# Altium project midi-synth.PrjPcb
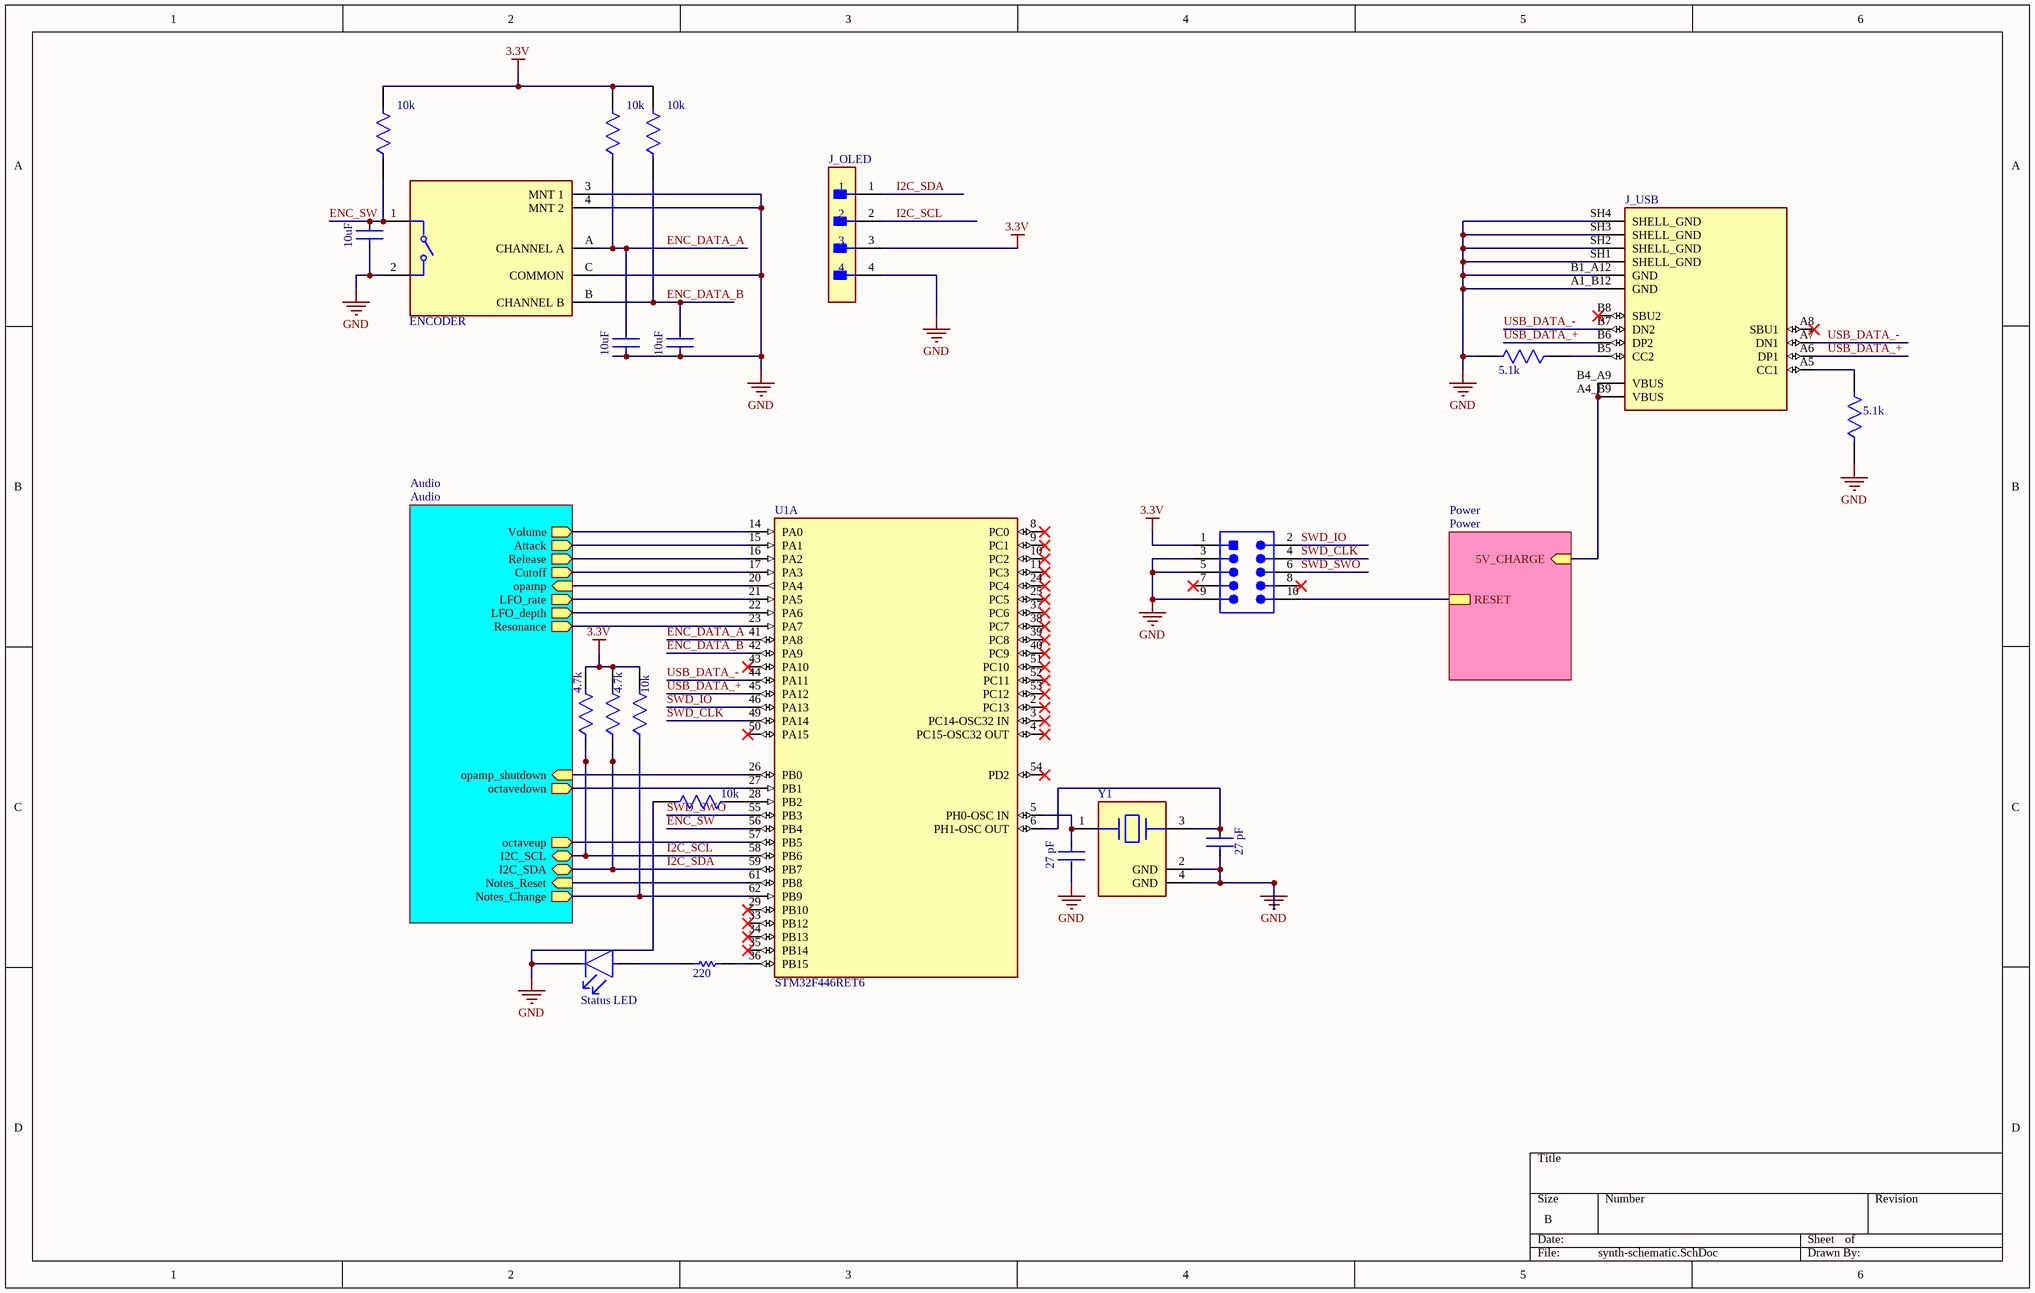
[diagram p0: synth-schematic.SchDoc]
3 sheets, 99 parts. Net scope: hierarchical (ports join the sheet entries above them; power ports are global).
Board file: synth.PcbDoc
Sheets:
  synth-schematic.SchDoc
    Power = Power.SchDoc
    Audio = Audio.SchDoc

## Sheet synth-schematic.SchDoc
size B; SheetNumber: 1; SheetTotal: 3

### Parts
C_ENC_A  10uF  [FP-C0603C106M8PACTU-MFG]
C_ENC_B  10uF  [FP-C0603C106M8PACTU-MFG]
C_ENC_SW  10uF  [FP-C0603C106M8PACTU-MFG]
C_Y_1  27 pF  [FP-C0603C-CF-MFG]
C_Y_2  27 pF  [FP-C0603C-CF-MFG]
ENCODER  PEC11R-4215F-S0024  [FP-PEC11R-4215F-S0024-MFG]  (value not drawn)
J_OLED  HTSW-104-07-G-S  [FP-HTSW-104-07-G-S-MFG]  (value not drawn)
J_USB  USB4105-GF-A-120  [GCT_USB4105-GF-A-120]  (value not drawn)
LED_R1  220  [RESC1608X55X25NL10T15]
R_BOOT_PD  10k  [FP-AC0603-IPC_A]
R_ENC_PU_2  10k  [FP-AC0603-IPC_A]
R_ENC_PU_3  10k  [FP-AC0603-IPC_A]
R_ENC_PU_?  10k  [FP-AC0603-IPC_A]
R_NOTES_PU  10k  [FP-AC0603-IPC_A]
R_PULLUP_SCL  4.7k  [FP-RT0603-MFG]
R_PULLUP_SDA  4.7k  [FP-RT0603-MFG]
R_USB_1  5.1k  [FP-MCT0603-IPC_B]
R_USB_2  5.1k  [FP-MCT0603-IPC_B]
STATUS_LED1  Status LED  [FP-LTST-C190KRKT-MFG]
SWD_HEADER  FTSH-105-01-F-DV-K  [SMTC-FTSH-105-01-L-DV-K_V]  (value not drawn)
U1  STM32F446RET6  [FP-LQFP64-5W-MFG]  (part A of 2)
Y1  ABM3B-8.000MHZ-B2-T  [FP-ABM3B-MFG]  (value not drawn)

### Sub-sheets
Audio = Audio: Volume (out), Attack (out), Release (out), Cutoff (out), LFO_rate (out), LFO_depth (out), Resonance (out), opamp (in), opamp_shutdown (in), octavedown (out), Notes_Reset (in), Notes_Change (out), I2C_SDA (bidir), octaveup (out), I2C_SCL (bidir)
Power = Power: 5V_CHARGE (in), RESET

### Nets
3.3V: J_OLED.3 R_ENC_PU_2.2 R_ENC_PU_3.2 R_ENC_PU_?.2 R_NOTES_PU.2 R_PULLUP_SCL.2 R_PULLUP_SDA.2 SWD_HEADER.1
GND: C_ENC_A.1 C_ENC_B.1 C_ENC_SW.1 C_Y_1.1 C_Y_2.2 ENCODER.2 ENCODER.3(MNT_1) ENCODER.4(MNT_2) ENCODER.C(COMMON) J_OLED.4 J_USB.A1_B12(GND) J_USB.B1_A12(GND) J_USB.SH1(SHELL_GND) J_USB.SH2(SHELL_GND) J_USB.SH3(SHELL_GND) J_USB.SH4(SHELL_GND) R_BOOT_PD.2 R_USB_1.1 R_USB_2.2 STATUS_LED1.1(C) SWD_HEADER.3 SWD_HEADER.5 SWD_HEADER.9 Y1.2(GND) Y1.4(GND)
ENC_DATA_A: C_ENC_A.2 ENCODER.A(CHANNEL_A) R_ENC_PU_?.1 U1.41(PA8)
ENC_DATA_B: C_ENC_B.2 ENCODER.B(CHANNEL_B) R_ENC_PU_2.1 U1.42(PA9)
ENC_SW: C_ENC_SW.2 ENCODER.1 R_ENC_PU_3.1 U1.56(PB4)
I2C_SCL: J_OLED.2 R_PULLUP_SCL.1 U1.58(PB6) ; sheet Audio/I2C_SCL
I2C_SDA: J_OLED.1 R_PULLUP_SDA.1 U1.59(PB7) ; sheet Audio/I2C_SDA
SWD_CLK: SWD_HEADER.4 U1.49(PA14)
SWD_IO: SWD_HEADER.2 U1.46(PA13)
SWD_SWO: SWD_HEADER.6 U1.55(PB3)
USB_DATA_+: J_USB.A6(DP1) J_USB.B6(DP2) U1.45(PA12)
USB_DATA_-: J_USB.A7(DN1) J_USB.B7(DN2) U1.44(PA11)
NetAttack_S: U1.15(PA1) ; sheet Audio/Attack
NetC_Cutoff_1: U1.17(PA3) ; sheet Audio/Cutoff
NetC_in_1: U1.20(PA4) ; sheet Audio/opamp
NetC_LFO_depth_1: U1.22(PA6) ; sheet Audio/LFO_depth
NetC_LFO_rate_1: U1.21(PA5) ; sheet Audio/LFO_rate
NetC_Release_1: U1.16(PA2) ; sheet Audio/Release
NetC_Reset_1: SWD_HEADER.10 ; sheet Power/RESET
NetC_Resonance_1: U1.23(PA7) ; sheet Audio/Resonance
NetC_VDD_2: J_USB.A4_B9(VBUS) J_USB.B4_A9(VBUS) ; sheet Power/5V_CHARGE
NetC_Volume_1: U1.14(PA0) ; sheet Audio/Volume
NetC_Y_1_2: C_Y_1.2 U1.6(PH1-OSC_OUT) Y1.3
NetC_Y_2_1: C_Y_2.1 U1.5(PH0-OSC_IN) Y1.1
NetJ_USB_A5: J_USB.A5(CC1) R_USB_1.2
NetJ_USB_B5: J_USB.B5(CC2) R_USB_2.1
NetLED_R1_1: LED_R1.1 STATUS_LED1.2(A)
NetLED_R1_2: LED_R1.2 U1.36(PB15)
NetOPAMP_1_1: U1.26(PB0) ; sheet Audio/opamp_shutdown
NetR_BOOT_PD_1: R_BOOT_PD.1 U1.28(PB2)
NetR_NOTES_PU_1: R_NOTES_PU.1 U1.62(PB9) ; sheet Audio/Notes_Change
NetS1_octaveup_1: U1.57(PB5) ; sheet Audio/octaveup
NetS2_octavedown_1: U1.27(PB1) ; sheet Audio/octavedown
NetU1_61: U1.61(PB8) ; sheet Audio/Notes_Reset

Not connected (* = marked no-connect by the designer): J_USB A8(SBU1)* B8(SBU2)*; SWD_HEADER 7* 8*; U1 2(PC13)* 3(PC14-OSC32_IN)* 4(PC15-OSC32_OUT)* 8(PC0)* 9(PC1)* 10(PC2)* 11(PC3)* 24(PC4)* 25(PC5)* 29(PB10)* 33(PB12)* 34(PB13)* 35(PB14)* 37(PC6)* 38(PC7)* 39(PC8)* 40(PC9)* 43(PA10)* 50(PA15)* 51(PC10)* 52(PC11)* 53(PC12)* 54(PD2)*

### Library data of the parts
C_ENC_A C_ENC_B C_ENC_SW = CMP-03020-034654-1: CAP CER 10UF 10V X5R 0603; RoHS Compliant: Yes
C_Y_1 C_Y_2 = CMP-03020-007366-1: CAP CER 27PF 100V NP0 0603; Manufacturer: KEMET; Manufacturer Part Number: C0603C270F1GACTU; Temperature Characteristic: C0G; Automotive Grade: Grade 1; Temperature Coefficient: 30ppm/°C; Tolerance: 0.01; Category: Cap; Mouser Description: Multilayer Ceramic Capacitors MLCC - SMD/SMT 100volts 27pF C0G 1%; Octopart: https://octopart.com/c0603c270f1gactu-kemet-9143729; ComponentLink2Description: Datasheet; Package: C0603C-CF; Device Class L2: Capacitors; Temperature Range Low: -55°C; Temperature Range High: +125°C; Height: 0.87mm; Digikey Description: CAP CER 27PF 100V NP0 0603; Temperature: -55°C to +125°C; Device Class L1: Passive Components; Value: 27 pF; Lead Free: Yes; Automotive: Yes; RoHS: TRUE; Device Class L3: Ceramic Capacitors; ComponentLink2URL: https://api.kemet.com/component-edge/download/datasheet/C0603C100J5GACAUTO.pdf; Capacitance: 27 pF; Material: Ceramic; Voltage Rating: 100 V
ENCODER = CMP-1747-00012-2: ROTARY ENCODER MECHANICAL 24PPR; Hole Diameter: 1.8mm; Output Type: Quadrature; Pulses per Revolution: 24; Number of Channels: 2; Built in Switch: Yes; Min Operating Temperature: -30°C; Series: PEC11R; Type: Mechanical; Package Quantity: 150; Length: 21.5mm; Max Operating Temperature: 70°C; Encoder Type: Mechanical; Height: 13.4mm; Detent: Yes; Packaging: Bulk; Orientation: Vertical; Width: 12.5mm; Termination: PC Pins; Mount: Through Hole; REACH SVHC: No SVHC; Radiation Hardening: No; RoHS Compliant: Yes
J_OLED = CMP-02766-001776-1: CONN HEADER VERT 4POS 2.54MM; Gender: Male; Number of Contacts: 4; Packaging: Bulk; RoHS Compliant: Yes; Number of Rows: 1; Mount: Through Hole; Contact Material: Bronze; Series: HTSW; Radiation Hardening: No; Pitch: 2.54mm; Reach SVHC Compliant: Yes; Contact Plating: Gold; Termination: Through Hole
J_USB = USB4105-GF-A-120: USB CONN, 2.0 TYPE C, RCPT, 16POS, SMT; USB Connector Type:USB Type C; USB Standard:USB 2.0; Gender:Receptacle; No. of Positions:16Positions; Connector Mounting:Surface Mount, Through Hole Mount; Orientation:Right Angle RoHS Compliant: Yes; MF: Global Connector Technology; MP: USB4105GFA120; SnapEDA_Link: https://www.snapeda.com/parts/USB4105GFA120/Global+Connector+Technology/view-part/?ref=snap; Package: None; Value: *; Check_prices: https://www.snapeda.com/parts/USB4105GFA120/Global+Connector+Technology/view-part/?ref=eda
LED_R1 = CMP-2000-04322-1: Part Number: RC0603JR-13220RL; Manufacturer: Yageo
R_BOOT_PD R_ENC_PU_2 R_ENC_PU_3 R_ENC_PU_? R_NOTES_PU = CMP-03412-040683-1: RES 10kΩ 5.00% 0.2W 0603
R_PULLUP_SCL R_PULLUP_SDA = CMP-03412-034306-1: RT0603 4.7KΩ 0.1W 25 ppm/°C 0.10%; Manufacturer: Yageo; Manufacturer Part Number: RT0603BRD134K7L; Tolerance: 0.001; Voltage Rating: 75V; Series: RT; Device Class L3: Chip SMD Resistors; Temperature Range High: +155°C; Height: 0.55mm; Temperature Range Low: -55°C; Resistance: 4.7KΩ; Composition: Thin Film; Temperature Coefficient: 25 ppm/°C; Device Class L1: Passive Components; Footprint Url: http://www.yageo.com/exep/pages/download/literatures/PYu-R_Mount_10.pdf; Automotive: No; Category: Res; ComponentLink2URL: http://www.yageo.com/documents/recent/PYu-RT_1-to-0.01_RoHS_L_9.pdf; Temperature: -55°C to +155°C; Ipc Land Pattern Name: RESC16080X45; RoHS: TRUE; Power Rating: 0.1W; Octopart: https://octopart.com/rt0603brd134k7l-yageo-91016342; Package: RT0603; Lead Free: Yes; Value: 4.7KΩ; Device Class L2: Resistors; ComponentLink2Description: Datasheet
R_USB_1 R_USB_2 = CMP-02407-010205-1: RES SMD 100 OHM 1% 1/8W 0603; Resistance: 5.1kR; Tolerance: 0.1%; Temperature Coefficient: 25ppm/°C; Max Operating Temperature: 125°C; Radiation Hardening: No; Composition: Thin Film; Height: 450um; Lead Free: Lead Free; Contact Plating: Tin; Length: 1.55mm; Width: 850um; Case/Package: 0603; Min Operating Temperature: -55°C
STATUS_LED1 = CMP-1674-00011-2: LED RED CLEAR CHIP SMD; Reverse Voltage: 5V; Viewing Angle: 130°; Power Rating: 75mW; Test Current: 20mA; Number of Elements: 1; Lens Color: Colorless; Wavelength: 639nm; Dominant Wavelength: 631nm; Lens Style: Diffused; Forward Current: 30mA; Forward Voltage: 2.4V; Luminous Intensity: 54mcd; Color: Red; Case Code (Imperial): 0603; Lens Transparency: Clear; Lead Free: Lead Free; Package Quantity: 1; Packaging: Tape and Reel; Max Operating Temperature: 85°C; Number of Pins: 2; Height: 0.8mm; Case/Package: 0603; Number of LEDs: 1; Width: 0.8mm; Case Code (Metric): 1608; Depth: 0.8mm; Mount: Surface Mount; Radiation Hardening: No; Length: 1.6mm; Illumination Color: Red; Power Dissipation: 75mW; Min Operating Temperature: -55°C
SWD_HEADER = CMP-2000-05352-1: Male Header, Pitch 1.27 mm, 2 x 5 Position, Height 6.12 mm, RoHS, Tube; Manufacturer: Samtec; Number of Positions: 10; Connector Type: Header,Shrouded; Number of Positions Loaded: All; Row Spacing: 0.050"(1.27mm); Fastening Type: -; Package Reference: FTSH-105-01-L-DV-K; Termination: Solder; Package URL: http://suddendocs.samtec.com/prints/ftsh-1xx-xx-xxx-dv-xxx-footprint.pdf; Number of Rows: 2; Contact Finish Thickness: 3µin(0.08µm); Contact Type: MalePin; Manufacturer URL: http://www.samtec.com/; Contact Mating Length: 0.120"(3.05mm); Pitch: 0.050"(1.27mm); Series: FTSH; Features: -; Contact Finish: Gold; Color: Black; Family: RectangularConnectors-Headers,MalePins; Datasheet URL: http://suddendocs.samtec.com/prints/ftsh-1xx-xx-xxx-dv-xxx-mkt.pdf; Package Description: Male Header, Pitch 1.27 mm, 2 x 5 Position, Height 5.97 mm, Tail Length 4.32 mm; Mounting Type: SurfaceMount; Datasheet Version: Rev. ET, 10/1995; Category: Connectors,Interconnects; Packaging: Tube
U1 = CMP-12105-000007-1: IC MCU 32BIT 512KB FLASH 64LQFP; Manufacturer: ST; Number Of Spi Channels: 4; Ram Size: 128KBytes; Standoff Height: 0.05mm; Number Of Uart Channels: 6; Number Of Pwm Channels: 32; Max Junction Temp: +105°C; Number Of I/Os: 50; Number Of Usb Channels: 2; Frequency: 180MHz; Number Of A/D Converters: 3; Max Supply Voltage: 3.6V; Number Of Adc Channels: 16; Interface: I2C,SPI,UART,USART,CAN,USB,LIN,IrDA,I2S,Other; Memory Size: 512KBytes; Number Of Timers/Counters: 14; Min Supply Voltage: 1.7V; Core Architecture: ARM Cortex-M4; Data Bus Width: 32bits; Number Of Cores: 1; Ambient Temperature Range Low: -40°C; ComponentLink2URL: https://www.st.com/en/microcontrollers-microprocessors/stm32f446re.html; Category: IC; Height: 1.6mm; Ipc Land Pattern Name: QFP50P1200X1200X160-64; Manufacturer Part Number: STM32F446RET6; Octopart: https://octopart.com/stm32f446ret6-stmicroelectronics-52642920; Temperature Range High: +105°C; Lead Free: Yes; Mouser Description: ARM Microcontrollers - MCU High-performance and DSP with FP, ARM Cortex-M4 MCU with 512 Kbytes Flash, 180 MHz CPU, Art Accelerator, SDRAM; Digikey Description: IC MCU 32BIT 512KB FLASH 64LQFP; Ambient Temperature Range High: +85°C; Number Of I2C Channels: 4; Memory Type: FLASH; RoHS: TRUE; Automotive: No; Device Class L1: Integrated Circuits (ICs); Temperature: -40°C to +105°C; Device Class L2: Embedded Processors and Controllers; Device Class L3: Microcontrollers; Temperature Range Low: -40°C; Package: LQFP64-5W; ComponentLink2Description: Datasheet
Y1 = CMP-1688-00002-2: Crystal 8MHz ±20ppm 18pF SMD-4 5mm x 3.2mm; ESR (Equivalent Series Resistance): 200R; Frequency Stability: 50ppm; Operating Frequency: 8 MHz; Mount: Surface Mount; Number of Pins: 4; Packaging: Tape and Reel; Width: 0.126inch; Case/Package: CSMD; Lead Free: Lead Free; Depth: 3.2mm; Load Capacitance: 18pF; Min Operating Temperature: -20°C; Series: ABM3B; Package Quantity: 1000; Resistor Type: Ceramic; Height: 0.043inch; Max Operating Temperature: 70°C; Frequency Tolerance: 20ppm; Series Resistance: 200R; Tolerance: 20ppm; Termination: SMD/SMT; Length: 5mm; Frequency: 8MHz

## Sheet Power.SchDoc
size B; SheetNumber: 2; SheetTotal: 3
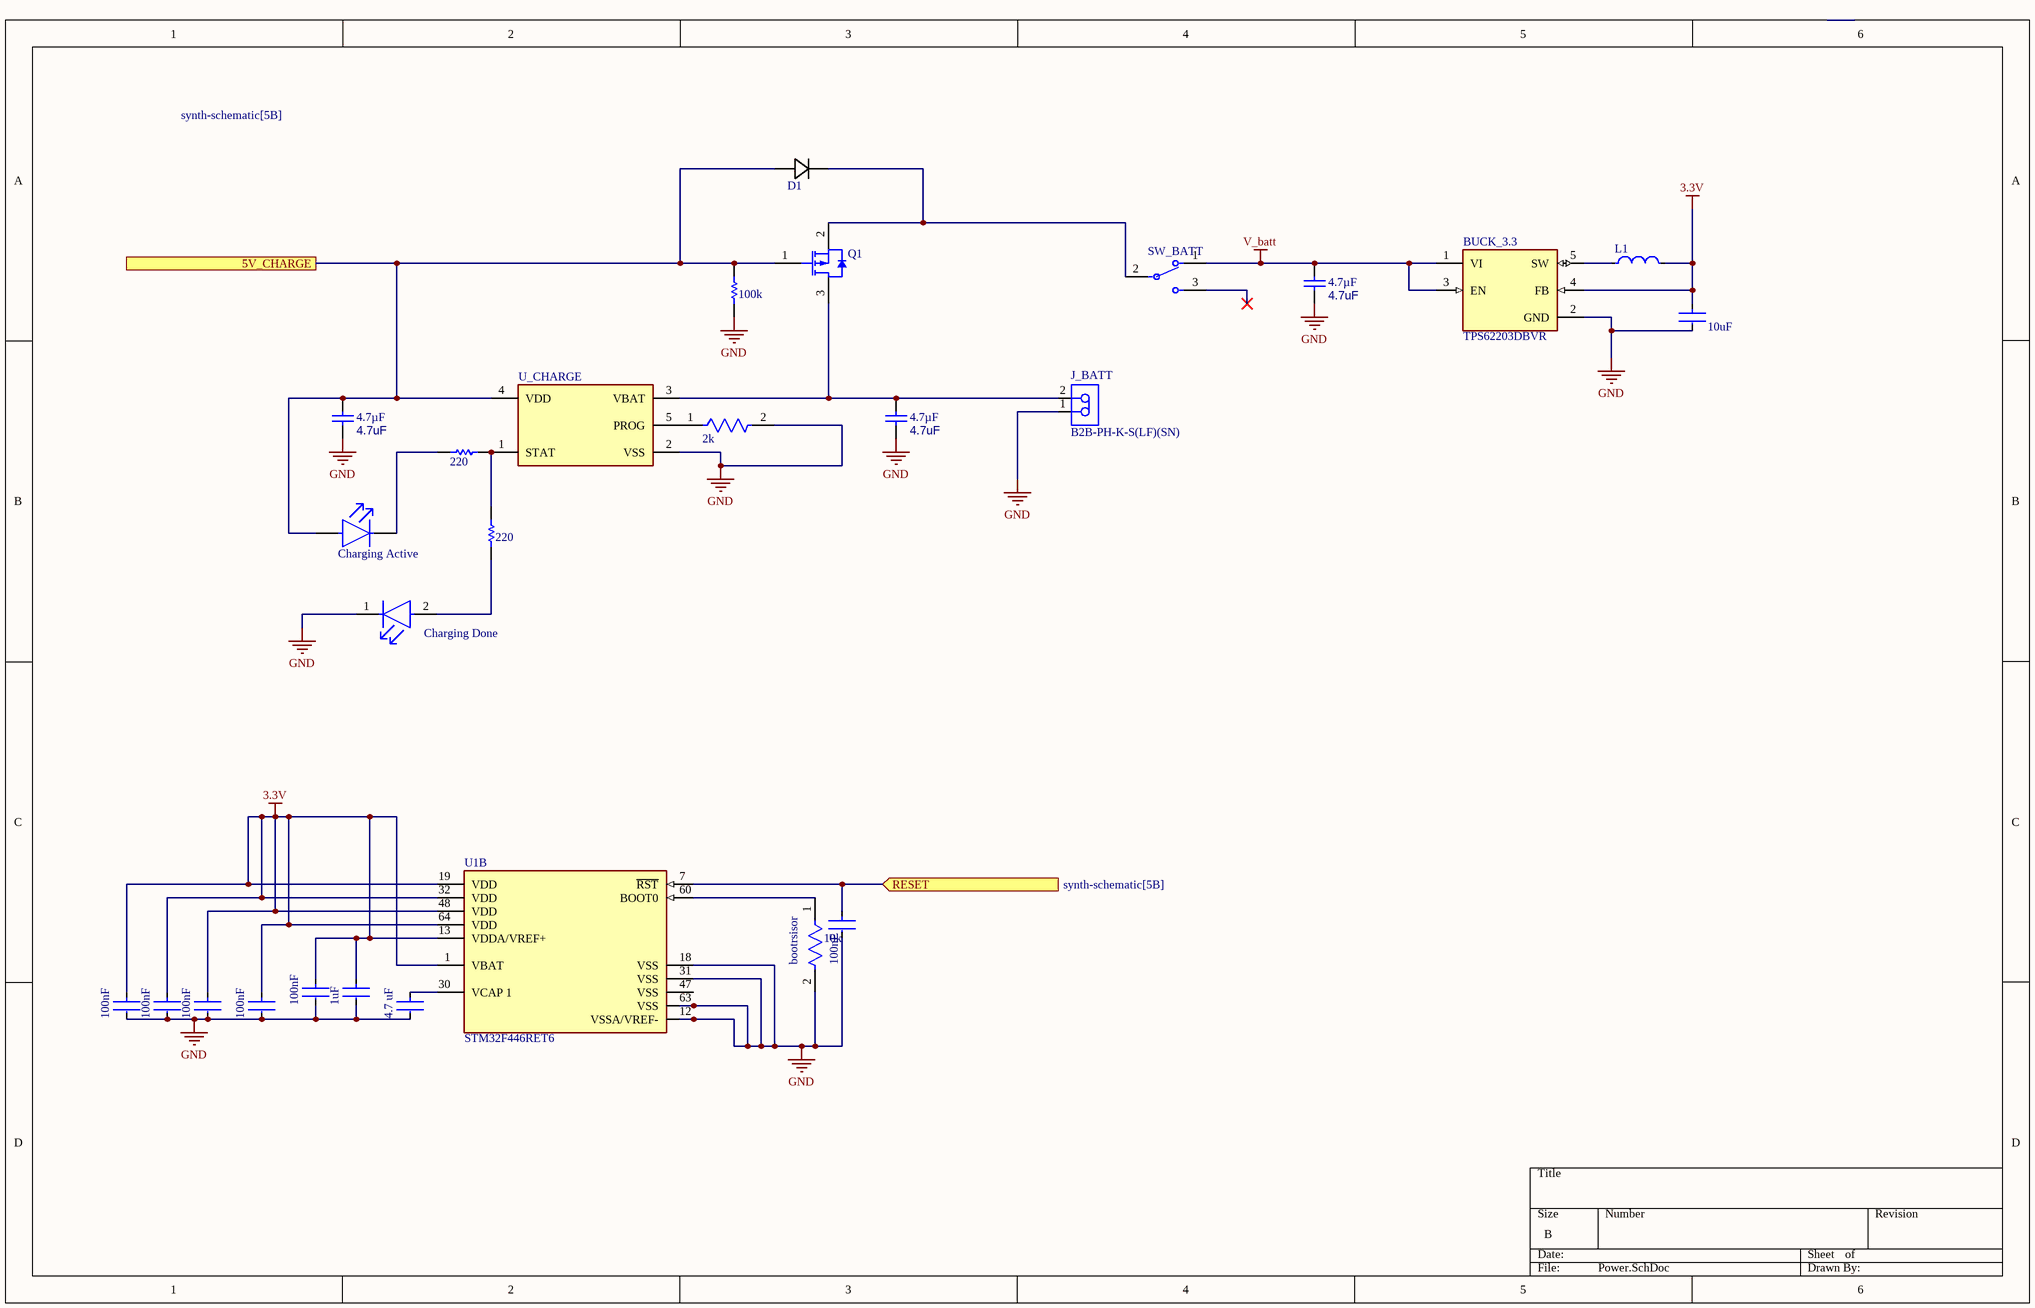
[diagram p1: Power.SchDoc]

### Parts
bootrsisor  10k  [FP-RT0603-MFG]
BUCK_3.3  TPS62203DBVR  [FP-DBV0005A-IPC_B]
C_BUCK  10uF  [FP-CC0603-DC-MFG]
C_CAP  4.7 uF  [FP-CC0603-DA-MFG]
C_PD_1  100nF  [FP-C0603C-CF-MFG]
C_PD_2  100nF  [FP-C0603C-CF-MFG]
C_PD_3  100nF  [FP-C0603C-CF-MFG]
C_PD_4  100nF  [FP-C0603C-CF-MFG]
C_PD_?  100nF  [FP-C0603C-CF-MFG]
C_Reset  100nF  [FP-C0603C-CF-MFG]
C_VDD  4.7uF  value 4.7µF  [CAPC0603(1608)100_L]
C_VDD2  4.7uF  value 4.7µF  [CAPC0603(1608)100_L]
C_VDD?  4.7uF  value 4.7µF  [CAPC0603(1608)100_L]
C_VDD_2  1uF  [FP-C0603-CJ-MFG]
Charging_Done  APHD1608LZGCK  [FP-APHD1608LZGCK-MFG]  (value not drawn)
D1  PMEG40T10ERX  [CR_SOD123W_NEX]  (value not drawn)
J_BATT  B2B-PH-K-S(LF)(SN)  [JST-B2B-PH-K-S_V]
L1  MLZ1608N100LT000  [FP-MLZ1608-IPC_A]  (value not drawn)
Q1  AO3401A  [AO-SOT-23-3L_V]  (value not drawn)
R_LED_1  220  [RESC1608X55X25NL10T15]
R_LED_2  220  [RESC1608X55X25NL10T15]
R_PROG  2k  [FP-AC0603-IPC_A]
R_PU  100k  [RESC0603(1608)_N]
STATUS_LED?  Charging Active  [FP-LTST-C190KRKT-MFG]
SW_BATT  JS102011SAQN  [FP-JS102011SAQN-MFG]  (value not drawn)
U1  STM32F446RET6  [FP-LQFP64-5W-MFG]  (part B of 2)
U_CHARGE  MCP73831T-2ATI/OT  [FP-C04-091-OT-IPC_C]  (value not drawn)

### Ports
5V_CHARGE (see synth-schematic[5B]), RESET (in, see synth-schematic[5B])

### Nets
3.3V: BUCK_3.3.4(FB) C_BUCK.1 C_PD_1.1 C_PD_2.1 C_PD_3.1 C_PD_4.1 C_PD_?.1 C_VDD_2.2 L1.2 U1.1(VBAT) U1.13(VDDA/VREF+) U1.19(VDD) U1.32(VDD) U1.48(VDD) U1.64(VDD)
GND: bootrsisor.2 BUCK_3.3.2(GND) C_BUCK.2 C_CAP.2 C_PD_1.2 C_PD_2.2 C_PD_3.2 C_PD_4.2 C_PD_?.2 C_Reset.2 C_VDD.1 C_VDD2.1 C_VDD?.1 C_VDD_2.1 Charging_Done.1(C) J_BATT.1 R_PROG.2 R_PU.2 U1.12(VSSA/VREF-) U1.18(VSS) U1.31(VSS) U1.63(VSS) U_CHARGE.2(VSS)
V_batt: BUCK_3.3.1(VI) BUCK_3.3.3(EN) C_VDD2.2 SW_BATT.1
Netbootrsisor_1: bootrsisor.1 U1.60(BOOT0)
NetBUCK_3.3_5: BUCK_3.3.5(SW) L1.1
NetC_CAP_1: C_CAP.1 U1.30(VCAP_1)
NetC_Reset_1: C_Reset.1 U1.7(~{RST}) ; port RESET
NetC_VDD?_2: C_VDD?.2 J_BATT.2 Q1.3(DRAIN) U_CHARGE.3(VBAT)
NetC_VDD_2: C_VDD.2 D1.2(ANODE) Q1.1(GATE) R_PU.1 STATUS_LED?.2(A) U_CHARGE.4(VDD) ; port 5V_CHARGE
NetCharging_Done_2: Charging_Done.2(A) R_LED_2.1
NetD1_1: D1.1(CATHODE) Q1.2(SOURCE) SW_BATT.2(C)
NetR_LED_1_1: R_LED_1.1 STATUS_LED?.1(C)
NetR_LED_1_2: R_LED_1.2 R_LED_2.2 U_CHARGE.1(STAT)
NetR_PROG_1: R_PROG.1 U_CHARGE.5(PROG)

Not connected (* = marked no-connect by the designer): SW_BATT 3*; U1 47(VSS)

### Library data of the parts
bootrsisor = CMP-03412-024743-1: RES SMD 10K OHM 0.05% 1/10W 0603; Manufacturer: Yageo; Manufacturer Part Number: RT0603WRE0710KL; Power Rating: 0.1W; Value: 10KΩ; Voltage Rating: 75V; Tolerance: 0.0005; Temperature Coefficient: 50 ppm/°C; Height: 0.55mm; ComponentLink2URL: http://www.yageo.com/documents/recent/PYu-RT_1-to-0.01_RoHS_L_9.pdf; Mouser Description: Res SMD 10K Ohm 0.05% 1/10W 0603; Device Class L1: Passive Components; Octopart: https://octopart.com/rt0603wre0710kl-yageo-71396825; Lead Free: Yes; RoHS: TRUE; ComponentLink2Description: Datasheet; Package: RT0603; Ipc Land Pattern Name: RESC16080X45; Automotive: No; Temperature: -55°C to +155°C; Series: RT; Resistance: 10KΩ; Footprint Url: http://www.yageo.com/exep/pages/download/literatures/PYu-R_Mount_10.pdf; Temperature Range Low: -55°C; Digikey Description: RES SMD 10K OHM 0.05% 1/10W 0603; Category: Res; Device Class L3: Chip SMD Resistors; Temperature Range High: +155°C; Device Class L2: Resistors; Composition: Thin Film
BUCK_3.3 = CMP-04918-000656-1: IC REG BUCK 3.3V 300MA SOT23-5; Number of Outputs: 1; Nominal Supply Current: 15uA; Operating Supply Voltage: 6V; Min Input Voltage: 2.5V; Efficiency: 95%; Synchronous Rectifier: Yes; Output Type: Fixed; Switching Frequency: 1MHz; Output Configuration: Positive; Number of Pins: 5; Max Operating Temperature: 85°C; Output Voltage: 3.3V; Lead Free: Lead Free; Package Quantity: 3000; Output Current: 300mA; Min Output Voltage: 3.3V; Min Operating Temperature: -40°C; Packaging: Tape and Reel; Max Output Current: 300mA; Min Supply Voltage: 2.5V; RoHS Compliant: Yes; Supply Current: 15uA; Radiation Hardening: No; Quiescent Current: 15uA; Series: -; Contact Plating: Gold; Mount: Surface Mount; Case/Package: SOT-23-5; Max Input Voltage: 6V
C_BUCK = CMP-00621-81932632-1: CC0603KRX5R7BB106 Multilayer Ceramic Capacitor, 10 uF, 16 V, ± 10%, X5R, 0603 [1608 Metric]; Capacitance: 10µF; Voltage Rating: 16V; NexarPartId: 81932632; Height: 1mm; Halogen Free: Halogen Free; Dielectric: X5R; Max Operating Temperature: 85°C; Voltage Rating (DC): 16V; Material: Ceramic; Lead Free: Lead Free; Tolerance: 10%; RoHS: Non-Compliant; Min Operating Temperature: -55°C; Case/Package: 0603
C_CAP = CMP-03422-001204-1: CAP CER 4.7UF 25V X5R 0603; Manufacturer: YAGEO; Manufacturer Part Number: CC0603MRX5R8BB475; Temperature Coefficient: 15%; Tolerance: 0.2; Category: Cap; Package: CC0603-DA; Capacitance: 4.7 uF; Temperature: -55°C to +125°C; ComponentLink2Description: Datasheet; Octopart: https://octopart.com/cc0603mrx5r8bb475-yageo-81932637; Value: 4.7 uF; Voltage Rating: 25 V; Automotive: No; Device Class L2: Capacitors; Temperature Characteristic: X5R; Height: 0.9mm; Device Class L3: Ceramic Capacitors; Lead Free: Yes; Voltage: 25 V; Footprint Url: http://www.yageo.com/exep/pages/download/literatures/UPY-C_GEN_24.pdf; ComponentLink2URL: http://www.yageo.com/documents/recent/UPY-GPHC_X7R_6.3V-to-50V_18.pdf; Digikey Description: CAP CER 4.7UF 25V X5R 0603; Temperature Range Low: -55°C; Device Class L1: Passive Components; RoHS: TRUE; Material: Ceramic; Temperature Range High: +125°C
C_PD_1-C_PD_4 C_PD_? C_Reset = CMP-03020-027569-2: C0603 0.10 μF Y5V 30ppm/°C 20.00% 25 V; Manufacturer: KEMET; Manufacturer Part Number: C0603C104M3VAC7411; Value: 0.10 μF; Voltage Rating: 25 V; Automotive Grade: Grade 1; Tolerance: 0.2; ComponentLink2URL: https://api.kemet.com/component-edge/download/datasheet/C0603C100J5GACAUTO.pdf; Package: C0603C-CF; Lead Free: Yes; Device Class L1: Passive Components; Temperature Range High: +125°C; Material: Ceramic; ComponentLink2Description: Datasheet; Automotive: Yes; Temperature: -55°C to +125°C; Temperature Characteristic: Y5V; Capacitance: 0.10 μF; Octopart: https://octopart.com/c0603c104m3vac7411-kemet-2224281; Height: 0.87mm; RoHS: TRUE; Temperature Range Low: -55°C; Device Class L3: Ceramic Capacitors; Temperature Coefficient: 30ppm/°C; Category: Cap; Device Class L2: Capacitors
C_VDD C_VDD2 C_VDD? = CMP-001-00076-4: Chip Capacitor, 4.7µF +/-20%, 10V, 0603, Thickness 1 mm; Tolerance: 10%; Mounting Technology: SMT; Case/Package: 0603; Pins: 2; Min Operating Temperature: -55°C; Max Operating Temperature: 85°C; Voltage Rating: 10V
C_VDD_2 = CMP-03020-024138-1: CAP CER 0603 1UF 10V X7R 10%; Manufacturer: KEMET; Manufacturer Part Number: C0603C105K8RACAUTO; Temperature Coefficient: 15%; Automotive Grade: Grade 1; Device Class L3: Ceramic Capacitors; Octopart: https://octopart.com/c0603c105k8racauto-kemet-91328492; Capacitance: 1uF; Voltage Rating: 10V; Device Class L2: Capacitors; Lead Free: Yes; Device Class L1: Passive Components; ComponentLink2URL: https://content.kemet.com/datasheets/KEM_C1023_X7R_AUTO_SMD.pdf; Temperature Characteristic: X7R; Temperature Range Low: -55°C; Temperature Range High: +125°C; Material: Ceramic; Category: Cap; Ipc Land Pattern Name: CAPC16080X80; Tolerance: 10%; Package: C0603-CJ; ComponentLink2Description: Datasheet; Temperature: -55°C to +125°C; RoHS: TRUE; Value: 1uF; Height: 0.95mm; Automotive: Yes; Digikey Description: CAP CER 0603 1UF 10V X7R 10%
Charging_Done = CMP-44529-000045-1: LED GREEN CLEAR 1608 SMD; Test Current: 2mA; Dominant Wavelength: 525nm; Lens Color: Colorless; Luminous Intensity: 180mcd; Viewing Angle: 100°; Forward Voltage: 2.65V; Lens Size: 0.7mm; Lens Style: Round; Mount: Surface Mount; Packaging: Tape and Reel; Lens Transparency: Clear; Height: 0.75mm; Case/Package: 0603; Length: 1.6mm; Case Code (Metric): 1608; Width: 0.8mm; Color: Green; Case Code (Imperial): 0603
D1 = PMEG40T10ERX: Description; Manufacturer_Name: Nexperia; Type: Diodes - Rectifiers, Single; Copyright: Copyright (C) 2025 Ultra Librarian. All rights reserved.; Manufacturer_Part_Number: PMEG40T10ERX
J_BATT = CMP-2000-05162-1: Male Header, Pitch 2 mm, 1 x 2 Position, Height 6 mm, Tail Length 3.4 mm, -25 to 85 degC, RoHS, Bulk; Manufacturer: JST; Pitch: 2mm; Style/Orientation: StraightHeader/Plug; No of Positions: 2; Datasheet Version: Nov-08; Datasheet URL: http://datasheet.octopart.com/B2B-PH-K-S%28LF%29%28SN%29-JST-datasheet-8324864.pdf; Manufacturer URL: http://www.jst.com/home2.html; Type: ShroudedHeader; Termination: Crimp
L1 = CMP-08253-000255-1: Shielded Multilayer Inductor 10uH ±20% 300mA 780mΩ SMD 0603; Self Resonant Frequency: 50MHz; Core Material: Ferrite; Saturation Current: 60mA; Test Frequency: 2MHz; DC Resistance (DCR): 780mR; Lead Free: Lead Free; Case Code (Metric): 1608; Min Operating Temperature: -55°C; Length: 0.063inch; Max Operating Temperature: 125°C; RoHS Compliant: Yes; Case/Package: 0603; Mount: Surface Mount; Tolerance: 20%; Packaging: Tape and Reel; Height - Seated (Max): 0.037inch; Shielding: Shielded; Case Code (Imperial): 0603; Current Rating: 300mA; Package Quantity: 4000; Width: 0.031inch; Inductance: 10uH
Q1 = CMP-2000-05778-1: P-Channel MOSFET, 30 V, 4 A, -55 to 150 degC, 3-Pin SOT-23-3L, RoHS, Tape and Reel; Manufacturer: Alpha and Omega; Output Power (Max): NotRequiredW; Power Dissipation: 1.4W; Rad Hardened: No; Drain Efficiency: NotRequired%; Drain-Source On-Volt: 30V; Noise Figure: NotRequireddB; Frequency (Max): NotRequiredMHz; Number of  Elements: 1; Gate-Source Voltage (Max): ?12V; Drain Current (Max): 4A; Channel Mode: Enhancement; Drain-Source On-Res: 0.044ohm; Type: PowerMOSFET; Polarity: P; Package URL: http://www.aosmd.com/res/packaging_information/SOT-23-3L.pdf; Datasheet URL: http://www.aosmd.com/res/data_sheets/AO3401A.pdf; Package Type: SOT-23; Package Description: 3-Pin Small Outline Transistor, Body 2.95 x 1.6 mm, Pitch 0.95 mm; Mounting: SurfaceMount; Manufacturer URL: http://www.aosmd.com/; Continuous Drain Current: 4A; Package Reference: SOT-23-3L; Mounting Technology: SurfaceMount; Operating Temperature Classification: Military; Power Gain: NotRequireddB; Datasheet Version: Rev. 3, 03/2011; Operating Temp Range: -55Cto150C; Pin Count: 3
R_LED_1 R_LED_2 = CMP-2000-04322-1: as LED_R1 on sheet synth-schematic
R_PROG = CMP-03412-038916-1: RES 2kΩ 1.00% 0.2W 0603
R_PU = CMP-1012-00736-1: 100K 0.1W 1% 0603 (1608 Metric)  SMD; Value: 100000.00 Ohm; Case-Metric: 1608; Case-EIA: 0603; Power: 0.1 W; Tolerance: 1 %; Technology: SMT
STATUS_LED? = CMP-1674-00011-2: as STATUS_LED1 on sheet synth-schematic; Color: Red; Case Code (Imperial): 0603; Lens Transparency: Clear; Lead Free: Lead Free; Package Quantity: 1; Packaging: Tape and Reel; Max Operating Temperature: 85°C; Number of Pins: 2; Height: 0.8mm; Case/Package: 0603; Number of LEDs: 1; Width: 0.8mm; Case Code (Metric): 1608; Depth: 0.8mm; Mount: Surface Mount; Radiation Hardening: No; Length: 1.6mm; Illumination Color: Red; Power Dissipation: 75mW; Min Operating Temperature: -55°C
SW_BATT = CMP-2000-06501-2: SWITCH SLIDE SPDT 300MA 6V; Switch Function: On-On; Illumination Type: Non-Illuminated; Switch Travel: 2mm; Contact Resistance: 70mR; Actuator Material: Nylon; Electrical Life: 5000Cycles; Actuator Type: Standard; Max Operating Temperature: 85°C; Housing Material: Nylon; Radiation Hardening: No; Max Voltage Rating (DC): 6V; Package Quantity: 1; Case/Package: 100; Actuator Length: 2mm; Min Operating Temperature: -40°C; Contact Current Rating: 300mA; REACH SVHC: No SVHC; Throw Configuration: SPDT; Packaging: Tape and Reel; Contact Material: Copper Alloy; Max Current Rating: 300mA; Current Rating: 300mA; Mount: Surface Mount; Lead Free: Lead Free; Termination: Gull Wing; Voltage Rating (DC): 6V; Length: 9mm; Orientation: Right Angle; Contact Plating: Silver
U1 = CMP-12105-000007-1: as U1 on sheet synth-schematic; Ambient Temperature Range Low: -40°C; ComponentLink2URL: https://www.st.com/en/microcontrollers-microprocessors/stm32f446re.html; Category: IC; Height: 1.6mm; Ipc Land Pattern Name: QFP50P1200X1200X160-64; Manufacturer Part Number: STM32F446RET6; Octopart: https://octopart.com/stm32f446ret6-stmicroelectronics-52642920; Temperature Range High: +105°C; Lead Free: Yes; Mouser Description: ARM Microcontrollers - MCU High-performance and DSP with FP, ARM Cortex-M4 MCU with 512 Kbytes Flash, 180 MHz CPU, Art Accelerator, SDRAM; Digikey Description: IC MCU 32BIT 512KB FLASH 64LQFP; Ambient Temperature Range High: +85°C; Number Of I2C Channels: 4; Memory Type: FLASH; RoHS: TRUE; Automotive: No; Device Class L1: Integrated Circuits (ICs); Temperature: -40°C to +105°C; Device Class L2: Embedded Processors and Controllers; Device Class L3: Microcontrollers; Temperature Range Low: -40°C; Package: LQFP64-5W; ComponentLink2Description: Datasheet
U_CHARGE = CMP-0133-00144-2: IC CONTROLLR LI-ION 4.2V SOT23-5; Max Supply Voltage: 6V; Max Output Current: 500mA; Min Output Voltage: 4.168V; Max Output Voltage: 4.232V; Min Supply Voltage: 3.75V; Number of Cells: 1; Lead Free: Lead Free; Number of Pins: 5; Package Quantity: 3000; Min Operating Temperature: -40°C; Width: 1.8mm; Max Charge Current: 500mA; Output Current: 500mA; Packaging: Tape and Reel; Height: 1.3mm; Output Voltage: 4.2V; Max Operating Temperature: 85°C; Mount: Surface Mount; Case/Package: SOT-23; Length: 3.1mm; REACH SVHC: No SVHC

## Sheet Audio.SchDoc
size B; SheetNumber: 3; SheetTotal: 3
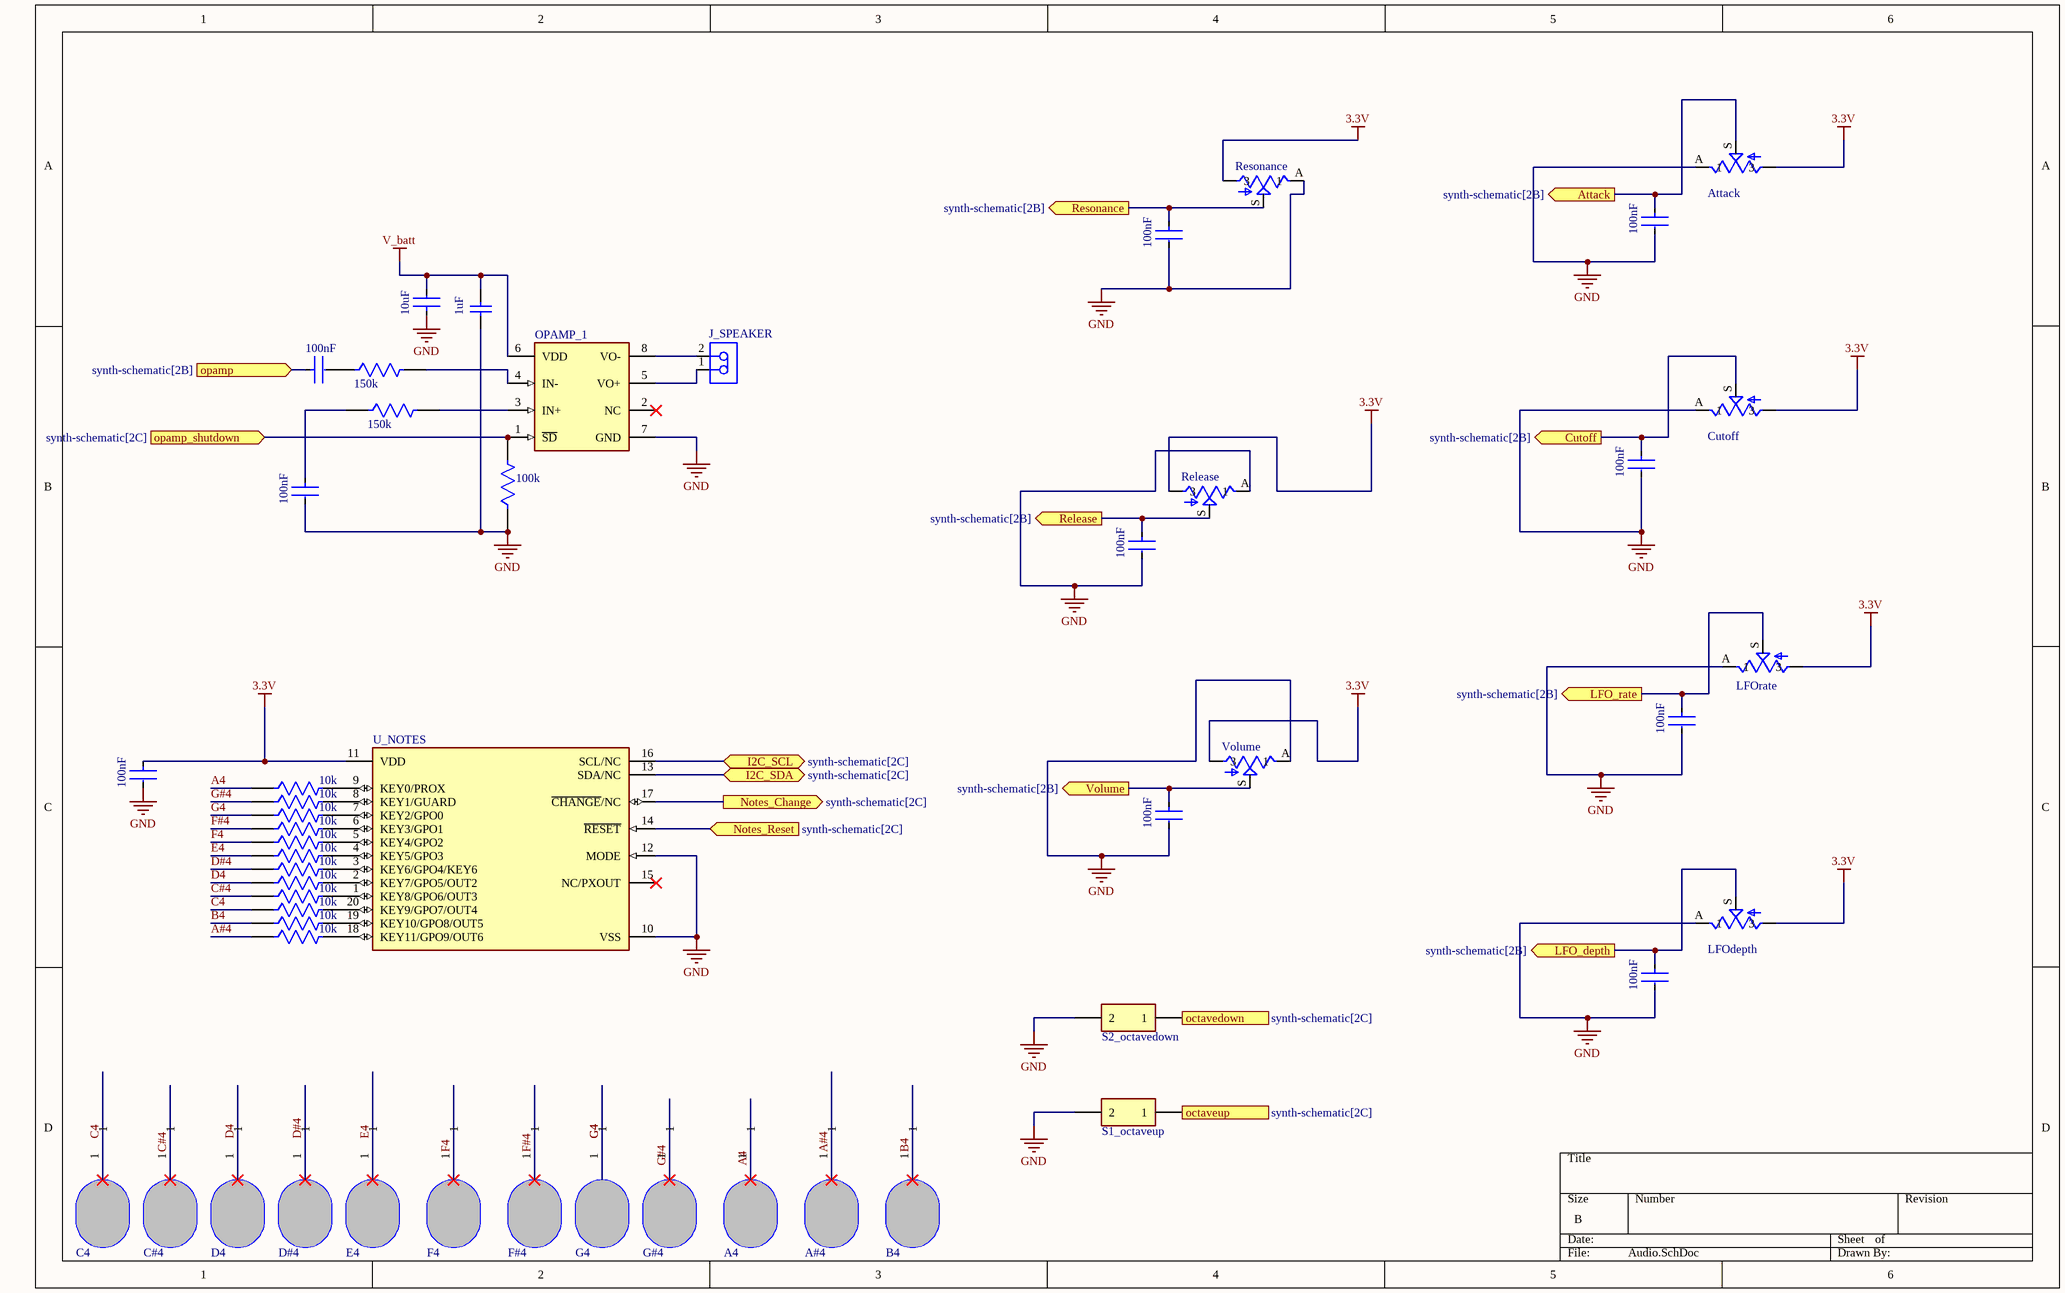
[diagram p2: Audio.SchDoc]

### Parts
A4  touchpad_note  [TOUCH_STAR]  (value not drawn)
A#4  touchpad_note  [TOUCH_STAR]  (value not drawn)
Attack  RK09K1130A6S  [RK09K1130A6S]  (value not drawn)
B4  touchpad_note  [TOUCH_STAR]  (value not drawn)
C4  touchpad_note  [TOUCH_STAR]  (value not drawn)
C#4  touchpad_note  [TOUCH_STAR]  (value not drawn)
C_Attack  100nF  [FP-C0603C-CF-MFG]
C_bulk  10uF  [FP-C0603C106M8PACTU-MFG]
C_Cutoff  100nF  [FP-C0603C-CF-MFG]
C_in  100nF  [FP-C0603C-CF-MFG]
C_LFO_depth  100nF  [FP-C0603C-CF-MFG]
C_LFO_rate  100nF  [FP-C0603C-CF-MFG]
C_opamp1  1uF  [CAPC1608X90X35ML15T15]
C_out  100nF  [FP-C0603C-CF-MFG]
C_Release  100nF  [FP-C0603C-CF-MFG]
C_Resonance  100nF  [FP-C0603C-CF-MFG]
C_u_notes  100nF  [FP-C0603C-CF-MFG]
C_Volume  100nF  [FP-C0603C-CF-MFG]
Cutoff  RK09K1130A6S  [RK09K1130A6S]  (value not drawn)
D4  touchpad_note  [TOUCH_STAR]  (value not drawn)
D#4  touchpad_note  [TOUCH_STAR]  (value not drawn)
E4  touchpad_note  [TOUCH_STAR]  (value not drawn)
F4  touchpad_note  [TOUCH_STAR]  (value not drawn)
F#4  touchpad_note  [TOUCH_STAR]  (value not drawn)
G4  touchpad_note  [TOUCH_STAR]  (value not drawn)
G#4  touchpad_note  [TOUCH_STAR]  (value not drawn)
J_SPEAKER  B2B-PH-K-S(LF)(SN)  [JST-B2B-PH-K-S_V]  (value not drawn)
LFOdepth  RK09K1130A6S  [RK09K1130A6S]  (value not drawn)
LFOrate  RK09K1130A6S  [RK09K1130A6S]  (value not drawn)
OPAMP_1  PAM8302AASCR  [FP-MSOP-8-MFG]  (value not drawn)
R_AMP  100k  [FP-CRGP0603-IPC_C]
R_OPAMP_1  150k  [FP-AT0603-MFG]
R_OPAMP_?  150k  [FP-AT0603-MFG]
Release  RK09K1130A6S  [RK09K1130A6S]  (value not drawn)
Resonance  RK09K1130A6S  [RK09K1130A6S]  (value not drawn)
RU_1  10k  [FP-AC0603-IPC_A]
RU_2  10k  [FP-AC0603-IPC_A]
RU_3  10k  [FP-AC0603-IPC_A]
RU_4  10k  [FP-AC0603-IPC_A]
RU_5  10k  [FP-AC0603-IPC_A]
RU_6  10k  [FP-AC0603-IPC_A]
RU_7  10k  [FP-AC0603-IPC_A]
RU_8  10k  [FP-AC0603-IPC_A]
RU_9  10k  [FP-AC0603-IPC_A]
RU_10  10k  [FP-AC0603-IPC_A]
RU_11  10k  [FP-AC0603-IPC_A]
RU_12  10k  [FP-AC0603-IPC_A]
S1_octaveup  PG151101S11  [SW_PG151101S11]  (value not drawn)
S2_octavedown  PG151101S11  [SW_PG151101S11]  (value not drawn)
U_NOTES  AT42QT2120-XUR  [FP-20X-MFG]  (value not drawn)
Volume  RK09K1130A6S  [RK09K1130A6S]  (value not drawn)

### Ports
Attack (out, see synth-schematic[2B]), Cutoff (out, see synth-schematic[2B]), I2C_SCL (bidir, see synth-schematic[2C]), I2C_SDA (bidir, see synth-schematic[2C]), LFO_depth (out, see synth-schematic[2B]), LFO_rate (out, see synth-schematic[2B]), Notes_Change (out, see synth-schematic[2C]), Notes_Reset (in, see synth-schematic[2C]), octavedown (out, see synth-schematic[2C]), octaveup (out, see synth-schematic[2C]), opamp (in, see synth-schematic[2B]), opamp_shutdown (in, see synth-schematic[2C]), Release (out, see synth-schematic[2B]), Resonance (out, see synth-schematic[2B]), Volume (out, see synth-schematic[2B])

### Nets
3.3V: Attack.E(3) C_u_notes.1 Cutoff.E(3) LFOdepth.E(3) LFOrate.E(3) Release.E(3) Resonance.E(3) U_NOTES.11(VDD) Volume.E(3)
GND: Attack.A(1) C_Attack.2 C_bulk.1 C_Cutoff.2 C_LFO_depth.2 C_LFO_rate.2 C_opamp1.1 C_out.2 C_Release.2 C_Resonance.2 C_u_notes.2 C_Volume.2 Cutoff.A(1) LFOdepth.A(1) LFOrate.A(1) OPAMP_1.7(GND) R_AMP.1 Release.A(1) Resonance.A(1) S1_octaveup.2 S2_octavedown.2 U_NOTES.10(VSS) U_NOTES.12(MODE) Volume.A(1)
V_batt: C_bulk.2 C_opamp1.2 OPAMP_1.6(VDD)
A4: A4.1 RU_1.1
A#4: A#4.1 RU_12.1
B4: B4.1 RU_11.1
C4: C4.1 RU_10.1
C#4: C#4.1 RU_9.1
D4: D4.1 RU_8.1
D#4: D#4.1 RU_7.1
E4: E4.1 RU_6.1
F4: F4.1 RU_5.1
F#4: F#4.1 RU_4.1
G4: G4.1 RU_3.1
G#4: G#4.1 RU_2.1
I2C_SCL: U_NOTES.16(SCL/NC) ; port I2C_SCL
I2C_SDA: U_NOTES.13(SDA/NC) ; port I2C_SDA
NetAttack_S: Attack.S C_Attack.1 ; port Attack
NetC_Cutoff_1: C_Cutoff.1 Cutoff.S ; port Cutoff
NetC_in_1: C_in.1 ; port opamp
NetC_in_2: C_in.2 R_OPAMP_1.1
NetC_LFO_depth_1: C_LFO_depth.1 LFOdepth.S ; port LFO_depth
NetC_LFO_rate_1: C_LFO_rate.1 LFOrate.S ; port LFO_rate
NetC_out_1: C_out.1 R_OPAMP_?.1
NetC_Release_1: C_Release.1 Release.S ; port Release
NetC_Resonance_1: C_Resonance.1 Resonance.S ; port Resonance
NetC_Volume_1: C_Volume.1 Volume.S ; port Volume
NetJ_SPEAKER_1: J_SPEAKER.1 OPAMP_1.5(VO+)
NetJ_SPEAKER_2: J_SPEAKER.2 OPAMP_1.8(VO-)
NetOPAMP_1_1: OPAMP_1.1(~{SD}) R_AMP.2 ; port opamp_shutdown
NetOPAMP_1_3: OPAMP_1.3(IN+) R_OPAMP_?.2
NetOPAMP_1_4: OPAMP_1.4(IN-) R_OPAMP_1.2
NetR_NOTES_PU_1: U_NOTES.17(~{CHANGE}/NC) ; port Notes_Change
NetRU_1_2: RU_1.2 U_NOTES.9(KEY0/PROX)
NetRU_2_2: RU_2.2 U_NOTES.8(KEY1/GUARD)
NetRU_3_2: RU_3.2 U_NOTES.7(KEY2/GPO0)
NetRU_4_2: RU_4.2 U_NOTES.6(KEY3/GPO1)
NetRU_5_2: RU_5.2 U_NOTES.5(KEY4/GPO2)
NetRU_6_2: RU_6.2 U_NOTES.4(KEY5/GPO3)
NetRU_7_2: RU_7.2 U_NOTES.3(KEY6/GPO4/KEY6)
NetRU_8_2: RU_8.2 U_NOTES.2(KEY7/GPO5/OUT2)
NetRU_9_2: RU_9.2 U_NOTES.1(KEY8/GPO6/OUT3)
NetRU_10_2: RU_10.2 U_NOTES.20(KEY9/GPO7/OUT4)
NetRU_11_2: RU_11.2 U_NOTES.19(KEY10/GPO8/OUT5)
NetRU_12_2: RU_12.2 U_NOTES.18(KEY11/GPO9/OUT6)
NetS1_octaveup_1: S1_octaveup.1 ; port octaveup
NetS2_octavedown_1: S2_octavedown.1 ; port octavedown
NetU1_61: U_NOTES.14(~{RESET}) ; port Notes_Reset

Not connected (* = marked no-connect by the designer): OPAMP_1 2(NC)*; U_NOTES 15(NC/PXOUT)*

### Library data of the parts
Attack Cutoff LFOdepth LFOrate Release Resonance Volume = RK09K1130A6S: 10k Ohm 1 Gang Linear Through Hole, Snap In Potentiometer None 1.0 Kierros 0.05W, 1/20W PC Pins; MF: ALPS; SnapEDA_Link: https://www.snapeda.com/parts/RK09K1130A6S/ALPS/view-part/?ref=snap; Package: None; Value: *; MP: RK09K1130A6S; Check_prices: https://www.snapeda.com/parts/RK09K1130A6S/ALPS/view-part/?ref=eda
C_Attack C_Cutoff C_in C_LFO_depth C_LFO_rate C_out C_Release C_Resonance C_u_notes C_Volume = CMP-03020-027569-2: as C_PD_1 on sheet Power; ComponentLink2URL: https://api.kemet.com/component-edge/download/datasheet/C0603C100J5GACAUTO.pdf; Package: C0603C-CF; Lead Free: Yes; Device Class L1: Passive Components; Temperature Range High: +125°C; Material: Ceramic; ComponentLink2Description: Datasheet; Automotive: Yes; Temperature: -55°C to +125°C; Temperature Characteristic: Y5V; Capacitance: 0.10 μF; Octopart: https://octopart.com/c0603c104m3vac7411-kemet-2224281; Height: 0.87mm; RoHS: TRUE; Temperature Range Low: -55°C; Device Class L3: Ceramic Capacitors; Temperature Coefficient: 30ppm/°C; Category: Cap; Device Class L2: Capacitors
C_bulk = CMP-03020-034654-1: CAP CER 10UF 10V X5R 0603; RoHS Compliant: Yes
C_opamp1 = CMP-1035-02733-2: Manufacturer: Kemet; Part Number: C0603C105K8RACTU
J_SPEAKER = CMP-2000-05162-1: as J_BATT on sheet Power; Datasheet Version: Nov-08; Datasheet URL: http://datasheet.octopart.com/B2B-PH-K-S%28LF%29%28SN%29-JST-datasheet-8324864.pdf; Manufacturer URL: http://www.jst.com/home2.html; Type: ShroudedHeader; Termination: Crimp
OPAMP_1 = CMP-12733-000002-1: IC AMP CLASS D MONO 2.5W 8MSOP; Manufacturer: Diodes Inc.; Nominal Supply Current: 4mA; Number Of Channels: 1; Max Junction Temp: +125°C; Min Supply Voltage: 2V; Power At Speaker R: 2.5W @ 4Ω; Max Supply Voltage: 5.5V; Voltage Gain: 24dB; Standoff Height: 0.05mm; Manufacturer Part Number: PAM8302AASCR; ComponentLink2URL: https://www.diodes.com/assets/Datasheets/PAM8302A.pdf; Mouser Description: Audio Amplifiers 2.5W MONO FILTERLESS CLASS-D AUDIO AMP; ComponentLink2Description: Datasheet; Temperature: -40°C to +85°C; Automotive: No; Footprint Url: https://www.diodes.com/assets/Package-Files/MSOP-8.pdf; Device Class L1: Integrated Circuits (ICs); Temperature Range Low: -40°C; Temperature Range High: +85°C; Lead Free: Yes; Package: MSOP-8; Height: 1.1mm; Category: IC; Ipc Land Pattern Name: SOP65P490X110-8; Octopart: https://octopart.com/pam8302aascr-diodes+inc.-29030473; RoHS: TRUE; Device Class L3: Amplifiers - Audio; Device Class L2: Linear ICs; Digikey Description: IC AMP CLASS D MONO 2.5W 8MSOP
R_AMP = CMP-03211-000885-1: CRGP 0603 100K 1%; Manufacturer: TE; Manufacturer Part Number: CRGP0603F100K; Power Rating: 0.25W; Resistance: 100KΩ; Voltage Rating: 50V; Value: 100KΩ; Tolerance: 0.01; Temperature Coefficient: ±100ppm/°C; Device Class L2: Resistors; Temperature: -55°C to +155°C; Temperature Range High: +155°C; Ambient Temperature Range High: +70°C; Lead Free: Yes; RoHS: TRUE; Octopart: https://octopart.com/crgp0603f100k-te+connectivity-91018719; Digikey Description: CRGP 0603 100K 1%; Automotive: No; ComponentLink2Description: Datasheet; Category: Res; Ipc Land Pattern Name: RESC16080X45; Device Class L3: Chip SMD Resistors; Composition: Thick Film; Temperature Range Low: -55°C; Height: 0.55mm; Device Class L1: Passive Components; Series: CRGP; Package: CRGP0603; ComponentLink2URL: https://www.te.com/commerce/DocumentDelivery/DDEController?Action=srchrtrv&DocNm=9-1773463-9&DocType=DS&DocLang=English
R_OPAMP_1 R_OPAMP_? = CMP-03412-030814-2: Thin Film Chip Resistors Automotive Grade 150kΩ 0.1% 50ppm/°C 0603; Resistance: 150kR; Max Power Dissipation: 100mW; Length: 0.063inch; Temperature Coefficient: 50ppm/°C; Packaging: Tape and Reel; Tolerance: 0.1%; Width: 0.032inch; Case/Package: 0603; Min Operating Temperature: -55°C; Features: Moisture Resistant; Max Operating Temperature: 155°C; Resistor Type: Thin Film; Series: AT; Height: 0.022inch; RoHS Compliant: Yes; Number of Terminations: 2
RU_1-RU_12 = CMP-03412-040683-1: RES 10kΩ 5.00% 0.2W 0603
S1_octaveup S2_octavedown = PG151101S11: MF: Kailh; SnapEDA_Link: https://www.snapeda.com/parts/PG151101S11/Kailh/view-part/?ref=snap; Package: Package; Value: *; MP: PG151101S11; Check_prices: https://www.snapeda.com/parts/PG151101S11/Kailh/view-part/?ref=eda
U_NOTES = CMP-06270-000024-1: IC TOUCH SENSOR 12CH 20TSSOP; Interface: I2C; Number of Channels: 12; Series: QTouch™; Max Operating Temperature: 85°C; Case/Package: TSSOP; RoHS Compliant: Yes; Number of Pins: 20; Min Operating Temperature: -40°C; Package Quantity: 4000; Packaging: Tape and Reel

## Nets that join several sheets
3.3V: synth-schematic (8 pins), Power (15 pins), Audio (9 pins)
GND: synth-schematic (25 pins), Power (23 pins), Audio (24 pins)
V_batt: Power (BUCK_3.3.1 BUCK_3.3.3 C_VDD2.2 SW_BATT.1), Audio (C_bulk.2 C_opamp1.2 OPAMP_1.6)
I2C_SCL: synth-schematic (J_OLED.2 R_PULLUP_SCL.1 U1.58), Audio (U_NOTES.16)
I2C_SDA: synth-schematic (J_OLED.1 R_PULLUP_SDA.1 U1.59), Audio (U_NOTES.13)
NetAttack_S: synth-schematic (U1.15), Audio (Attack.S C_Attack.1)
NetC_Cutoff_1: synth-schematic (U1.17), Audio (C_Cutoff.1 Cutoff.S)
NetC_in_1: synth-schematic (U1.20), Audio (C_in.1)
NetC_LFO_depth_1: synth-schematic (U1.22), Audio (C_LFO_depth.1 LFOdepth.S)
NetC_LFO_rate_1: synth-schematic (U1.21), Audio (C_LFO_rate.1 LFOrate.S)
NetC_Release_1: synth-schematic (U1.16), Audio (C_Release.1 Release.S)
NetC_Reset_1: synth-schematic (SWD_HEADER.10), Power (C_Reset.1 U1.7)
NetC_Resonance_1: synth-schematic (U1.23), Audio (C_Resonance.1 Resonance.S)
NetC_VDD_2: synth-schematic (J_USB.A4_B9 J_USB.B4_A9), Power (6 pins)
NetC_Volume_1: synth-schematic (U1.14), Audio (C_Volume.1 Volume.S)
NetOPAMP_1_1: synth-schematic (U1.26), Audio (OPAMP_1.1 R_AMP.2)
NetR_NOTES_PU_1: synth-schematic (R_NOTES_PU.1 U1.62), Audio (U_NOTES.17)
NetS1_octaveup_1: synth-schematic (U1.57), Audio (S1_octaveup.1)
NetS2_octavedown_1: synth-schematic (U1.27), Audio (S2_octavedown.1)
NetU1_61: synth-schematic (U1.61), Audio (U_NOTES.14)